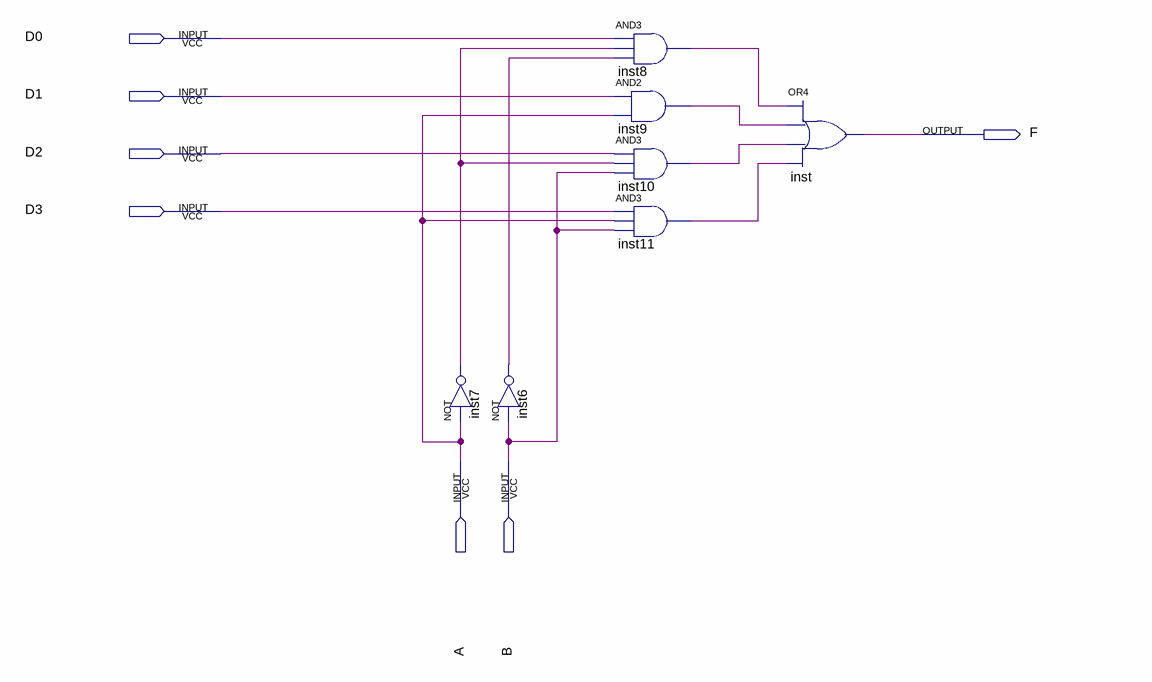
[diagram p0: schematic sheet]
// Quartus schematic multiplexer_4-1.bdf as structural Verilog: 7 symbols, 7 pins
module \multiplexer_4-1  (
  input  D0,
  input  D1,
  input  D2,
  input  D3,
  input  A,
  input  B,
  output F
);

  wire inst6_out, inst7_out, inst8_out, inst9_out, inst10_out, inst11_out;

  not inst7 (inst7_out, A);
  not inst6 (inst6_out, B);
  and inst8 (inst8_out, D0, inst7_out, inst6_out);
  and inst9 (inst9_out, D1, A);
  and inst10 (inst10_out, D2, inst7_out, B);
  and inst11 (inst11_out, D3, A, B);
  or inst (F, inst8_out, inst9_out, inst10_out, inst11_out);
endmodule
